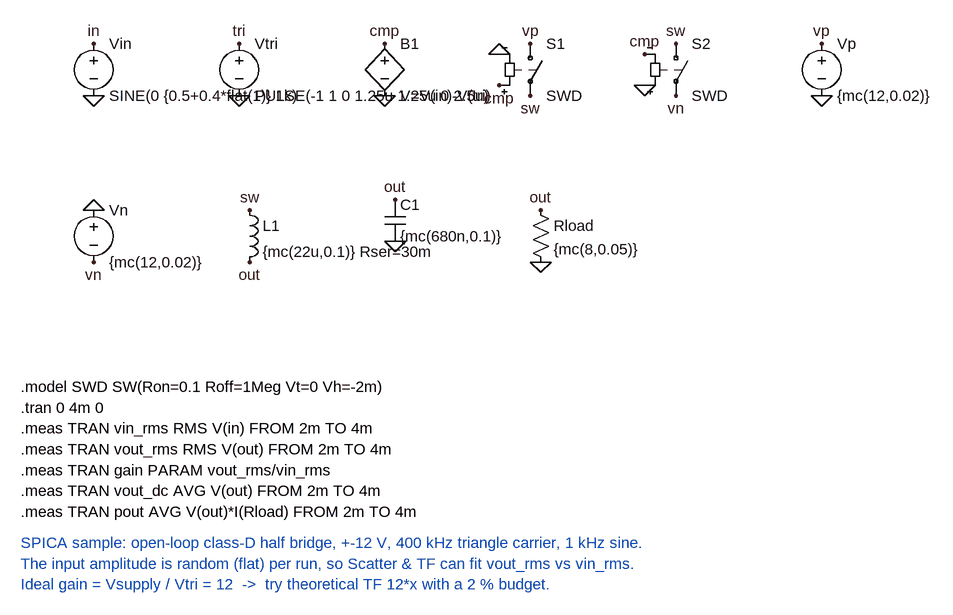
[diagram p0: schematic classd_amp.asc]
classd_amp.asc, the LTspice schematic file:
Version 4
SHEET 1 1600 1200
FLAG 144 80 in
FLAG 144 160 0
FLAG 368 80 tri
FLAG 368 160 0
FLAG 592 80 cmp
FLAG 592 160 0
FLAG 816 80 vp
FLAG 816 160 sw
FLAG 768 144 cmp
FLAG 768 96 0
FLAG 1040 80 sw
FLAG 1040 160 vn
FLAG 992 144 0
FLAG 992 96 cmp
FLAG 1264 80 vp
FLAG 1264 160 0
FLAG 144 336 0
FLAG 144 416 vn
FLAG 384 336 sw
FLAG 384 416 out
FLAG 608 320 out
FLAG 608 384 0
FLAG 832 336 out
FLAG 832 416 0
SYMBOL voltage 144 64 R0
SYMATTR InstName Vin
SYMATTR Value SINE(0 {0.5+0.4*flat(1)} 1k)
SYMBOL voltage 368 64 R0
SYMATTR InstName Vtri
SYMATTR Value PULSE(-1 1 0 1.25u 1.25u 0 2.5u)
SYMBOL bv 592 64 R0
SYMATTR InstName B1
SYMATTR Value V=V(in)-V(tri)
SYMBOL sw 816 64 R0
SYMATTR InstName S1
SYMATTR Value SWD
SYMBOL sw 1040 64 R0
SYMATTR InstName S2
SYMATTR Value SWD
SYMBOL voltage 1264 64 R0
SYMATTR InstName Vp
SYMATTR Value {mc(12,0.02)}
SYMBOL voltage 144 320 R0
SYMATTR InstName Vn
SYMATTR Value {mc(12,0.02)}
SYMBOL ind 368 320 R0
SYMATTR InstName L1
SYMATTR Value {mc(22u,0.1)} Rser=30m
SYMBOL cap 592 320 R0
SYMATTR InstName C1
SYMATTR Value {mc(680n,0.1)}
SYMBOL res 816 320 R0
SYMATTR InstName Rload
SYMATTR Value {mc(8,0.05)}
TEXT 32 608 Left 2 !.model SWD SW(Ron=0.1 Roff=1Meg Vt=0 Vh=-2m)
TEXT 32 640 Left 2 !.tran 0 4m 0
TEXT 32 672 Left 2 !.meas TRAN vin_rms RMS V(in) FROM 2m TO 4m
TEXT 32 704 Left 2 !.meas TRAN vout_rms RMS V(out) FROM 2m TO 4m
TEXT 32 736 Left 2 !.meas TRAN gain PARAM vout_rms/vin_rms
TEXT 32 768 Left 2 !.meas TRAN vout_dc AVG V(out) FROM 2m TO 4m
TEXT 32 800 Left 2 !.meas TRAN pout AVG V(out)*I(Rload) FROM 2m TO 4m
TEXT 32 848 Left 2 ;SPICA sample: open-loop class-D half bridge, +-12 V, 400 kHz triangle carrier, 1 kHz sine.
TEXT 32 880 Left 2 ;The input amplitude is random (flat) per run, so Scatter & TF can fit vout_rms vs vin_rms.
TEXT 32 912 Left 2 ;Ideal gain = Vsupply / Vtri = 12  ->  try theoretical TF 12*x with a 2 % budget.

The netlist it stands for:
* classd_amp.asc
Vin in 0 SINE(0 {0.5+0.4*flat(1)} 1k)
Vtri tri 0 PULSE(-1 1 0 1.25u 1.25u 0 2.5u)
B1 cmp 0 V=V(in)-V(tri)
S1 vp sw cmp 0 SWD
S2 sw vn 0 cmp SWD
Vp vp 0 {mc(12,0.02)}
Vn 0 vn {mc(12,0.02)}
L1 sw out {mc(22u,0.1)} Rser=30m
C1 out 0 {mc(680n,0.1)}
Rload out 0 {mc(8,0.05)}
.model SWD SW(Ron=0.1 Roff=1Meg Vt=0 Vh=-2m)
.tran 0 4m 0
.meas TRAN vin_rms RMS V(in) FROM 2m TO 4m
.meas TRAN vout_rms RMS V(out) FROM 2m TO 4m
.meas TRAN gain PARAM vout_rms/vin_rms
.meas TRAN vout_dc AVG V(out) FROM 2m TO 4m
.meas TRAN pout AVG V(out)*I(Rload) FROM 2m TO 4m
* SPICA sample: open-loop class-D half bridge, +-12 V, 400 kHz triangle carrier, 1 kHz sine.
* The input amplitude is random (flat) per run, so Scatter & TF can fit vout_rms vs vin_rms.
* Ideal gain = Vsupply / Vtri = 12  ->  try theoretical TF 12*x with a 2 % budget.
.backanno
.end